# EAGLE schematic 1794743541760_Budík (EAGLE 9.6.2)
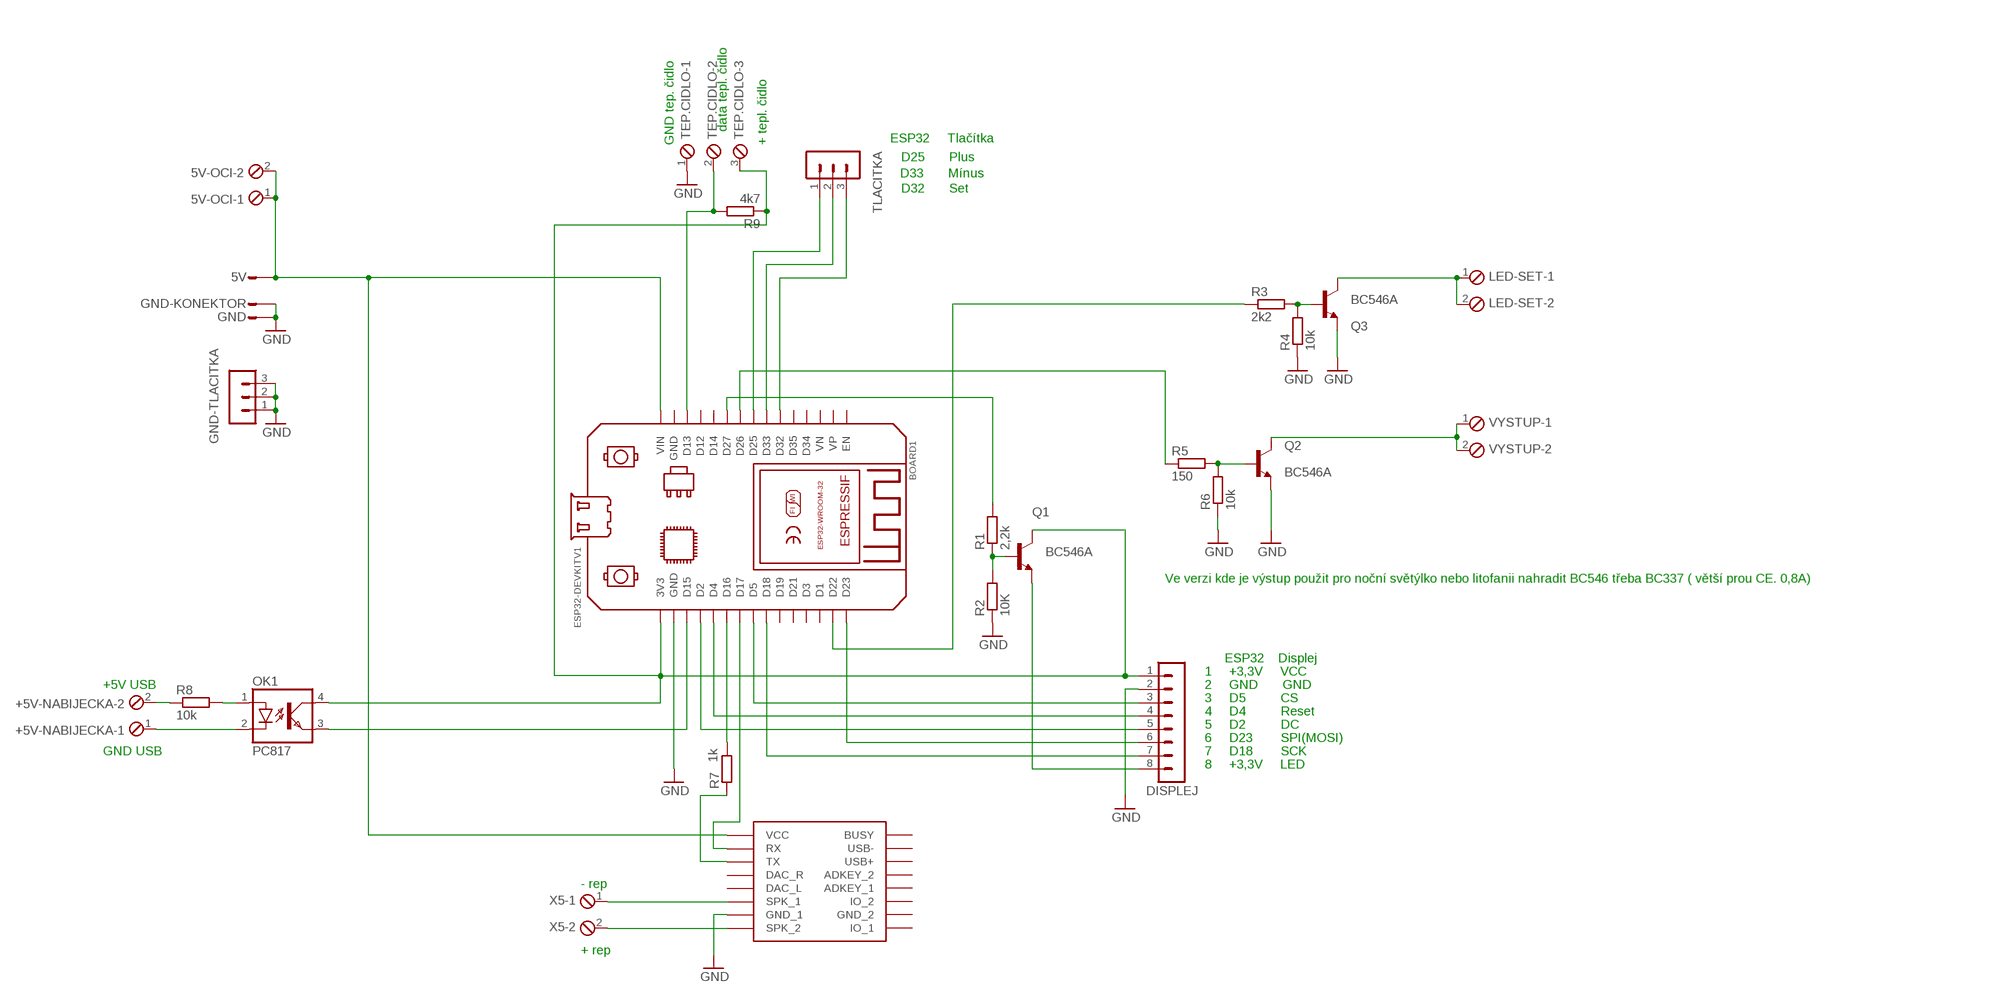
[diagram p0: schematic, sheet 1]

## Parts
5V  ST2,8  [ST2,8]
5V-OCI  MPT2  [2POL254]
+5V-NABIJECKA  MPT2  [2POL254]
BOARD1  ESP32DEVKITV1  [ESP32-DEVKITV1]
DISPLEJ  MA08-1  [MA08-1]
GND  ST2,8  [ST2,8]
GND-KONEKTOR  ST2,8  [ST2,8]
GND-TLACITKA  MA03-1  [MA03-1]
LED-SET  MPT2  [2POL254]
OK1  PC817  [DIL04]
Q1  BC546A  [TO92-EBC]
Q2  BC546A  [TO92-EBC]
Q3  BC546A  [TO92-EBC]
R1  2,2k  R-EU_0204/7  [0204/7]
R2  10K  R-EU_0204/7  [0204/7]
R3  2k2  R-EU_0204/7  [0204/7]
R4  10k  R-EU_0204/7  [0204/7]
R5  150  R-EU_0204/7  [0204/7]
R6  10k  R-EU_0204/7  [0204/7]
R7  1k  R-EU_0204/7  [0204/7]
R8  10k  R-EU_0204/7  [0204/7]
R9  4k7  R-EU_0204/7  [0204/7]
TEP.CIDLO  MPT3  [3POL254]
TLACITKA  MA03-1  [MA03-1]
U$1  DFPLAYER  [DFPLAYER]
VYSTUP  MPT2  [2POL254]
X5  MPT2  [2POL254]

## Nets
GND: BOARD1.GND@1(GND) DISPLEJ.2 GND-KONEKTOR.1(ST) GND-TLACITKA.1 GND-TLACITKA.2 GND-TLACITKA.3 GND.1(ST) Q2.E Q3.E R2.1 R4.1 R6.1 TEP.CIDLO.1 U$1.GND_1
N$1: 5V-OCI.1 5V-OCI.2 5V.1(ST) BOARD1.VIN U$1.VCC
N$2: Q3.B R3.2 R4.2
N$3: Q2.B R5.2 R6.2
N$4: +5V-NABIJECKA.2 R8.1
N$5: OK1.1(A) R8.2
N$6: U$1.SPK1(SPK_1) X5.1
N$7: U$1.SPK2(SPK_2) X5.2
N$8: BOARD1.3V3 DISPLEJ.1 OK1.4(COL) Q1.C R9.1 TEP.CIDLO.3
N$9: BOARD1.D15 OK1.3(EMIT)
N$10: BOARD1.D5 DISPLEJ.3
N$11: BOARD1.D4 DISPLEJ.4
N$12: BOARD1.D2 DISPLEJ.5
N$13: BOARD1.D23 DISPLEJ.6
N$14: BOARD1.D18 DISPLEJ.7
N$15: DISPLEJ.8 Q1.E
N$16: R7.1 U$1.TX
N$17: BOARD1.D17 U$1.RX
N$18: BOARD1.D16 R7.2
N$19: BOARD1.D13 R9.2 TEP.CIDLO.2
N$20: BOARD1.D25 TLACITKA.1
N$21: BOARD1.D33 TLACITKA.2
N$22: BOARD1.D32 TLACITKA.3
N$23: BOARD1.D27 R1.2
N$24: Q1.B R1.1 R2.2
N$25: BOARD1.D22 R3.1
N$26: BOARD1.D26 R5.1
N$27: Q2.C VYSTUP.1 VYSTUP.2
N$28: LED-SET.1 LED-SET.2 Q3.C
N$29: +5V-NABIJECKA.1 OK1.2(C)
Unconnected: BOARD1.D1 BOARD1.D3 BOARD1.D12 BOARD1.D14 BOARD1.D19 BOARD1.D21 BOARD1.D34 BOARD1.D35 BOARD1.EN BOARD1.GND BOARD1.VN BOARD1.VP U$1.ADKEY1(ADKEY_1) U$1.ADKEY2(ADKEY_2) U$1.BUSY U$1.DAC_L U$1.DAC_R U$1.GND_2 U$1.IO1(IO_1) U$1.IO2(IO_2) U$1.USB+ U$1.USB-

## Notes on the sheet
- data tepl. čidlo
- GND tep. čidlo | + tepl. čidlo | ESP32     Tlačítka
- D25       Plus
- D33       Mínus
- D32       Set
- Ve verzi kde je výstup použit pro noční světýlko nebo litofanii nahradit BC546 třeba BC337 ( větší prou CE. 0,8A)
- ESP32    Displej
- 1     +3,3V     VCC
- +5V USB | 2     GND       GND
- 3     D5          CS
- 4     D4          Reset
- 5     D2          DC
- 6     D23        SPI(MOSI)
- GND USB | 7     D18        SCK
- 8     +3,3V     LED
- - rep
- + rep

## Library data of the parts
5V GND GND-KONEKTOR = con-rib:ST2,8: RIBBON CABLE CONNECTOR Flachstecker / Faston; OC_FARNELL: unknown; OC_NEWARK: unknown
5V-OCI +5V-NABIJECKA LED-SET VYSTUP X5 = con-phoenix-254:MPT2: PHOENIX CONNECTOR; OC_FARNELL: unknown; OC_NEWARK: unknown
BOARD1 = ESP32-DEVKITV1:ESP32DEVKITV1: https://github.com/shridattdudhat
DISPLEJ = con-lstb:MA08-1: PIN HEADER; OC_FARNELL: unknown; OC_NEWARK: unknown
GND-TLACITKA TLACITKA = con-lstb:MA03-1: PIN HEADER; OC_FARNELL: unknown; OC_NEWARK: unknown
OK1 = optocoupler:PC817: SHARP OPTO COUPLER; MPN: PC817X4J000F; OC_FARNELL: 9707727; OC_NEWARK: 97K7059
Q1-Q3 = transistor-npn:BC546*: NPN Transistor
R1-R9 = rcl:R-EU_: RESISTOR, European symbol; SPICEPREFIX: R
TEP.CIDLO = con-phoenix-254:MPT3: PHOENIX CONNECTOR; OC_FARNELL: unknown; OC_NEWARK: unknown
U$1 = DFPlayer_v1:DFPLAYER

## Net classes
0 default: width 0.4 mm, drill 0.1 mm, clearance 0.1 mm